# EAGLE design a13pg (EAGLE 9.6.2)
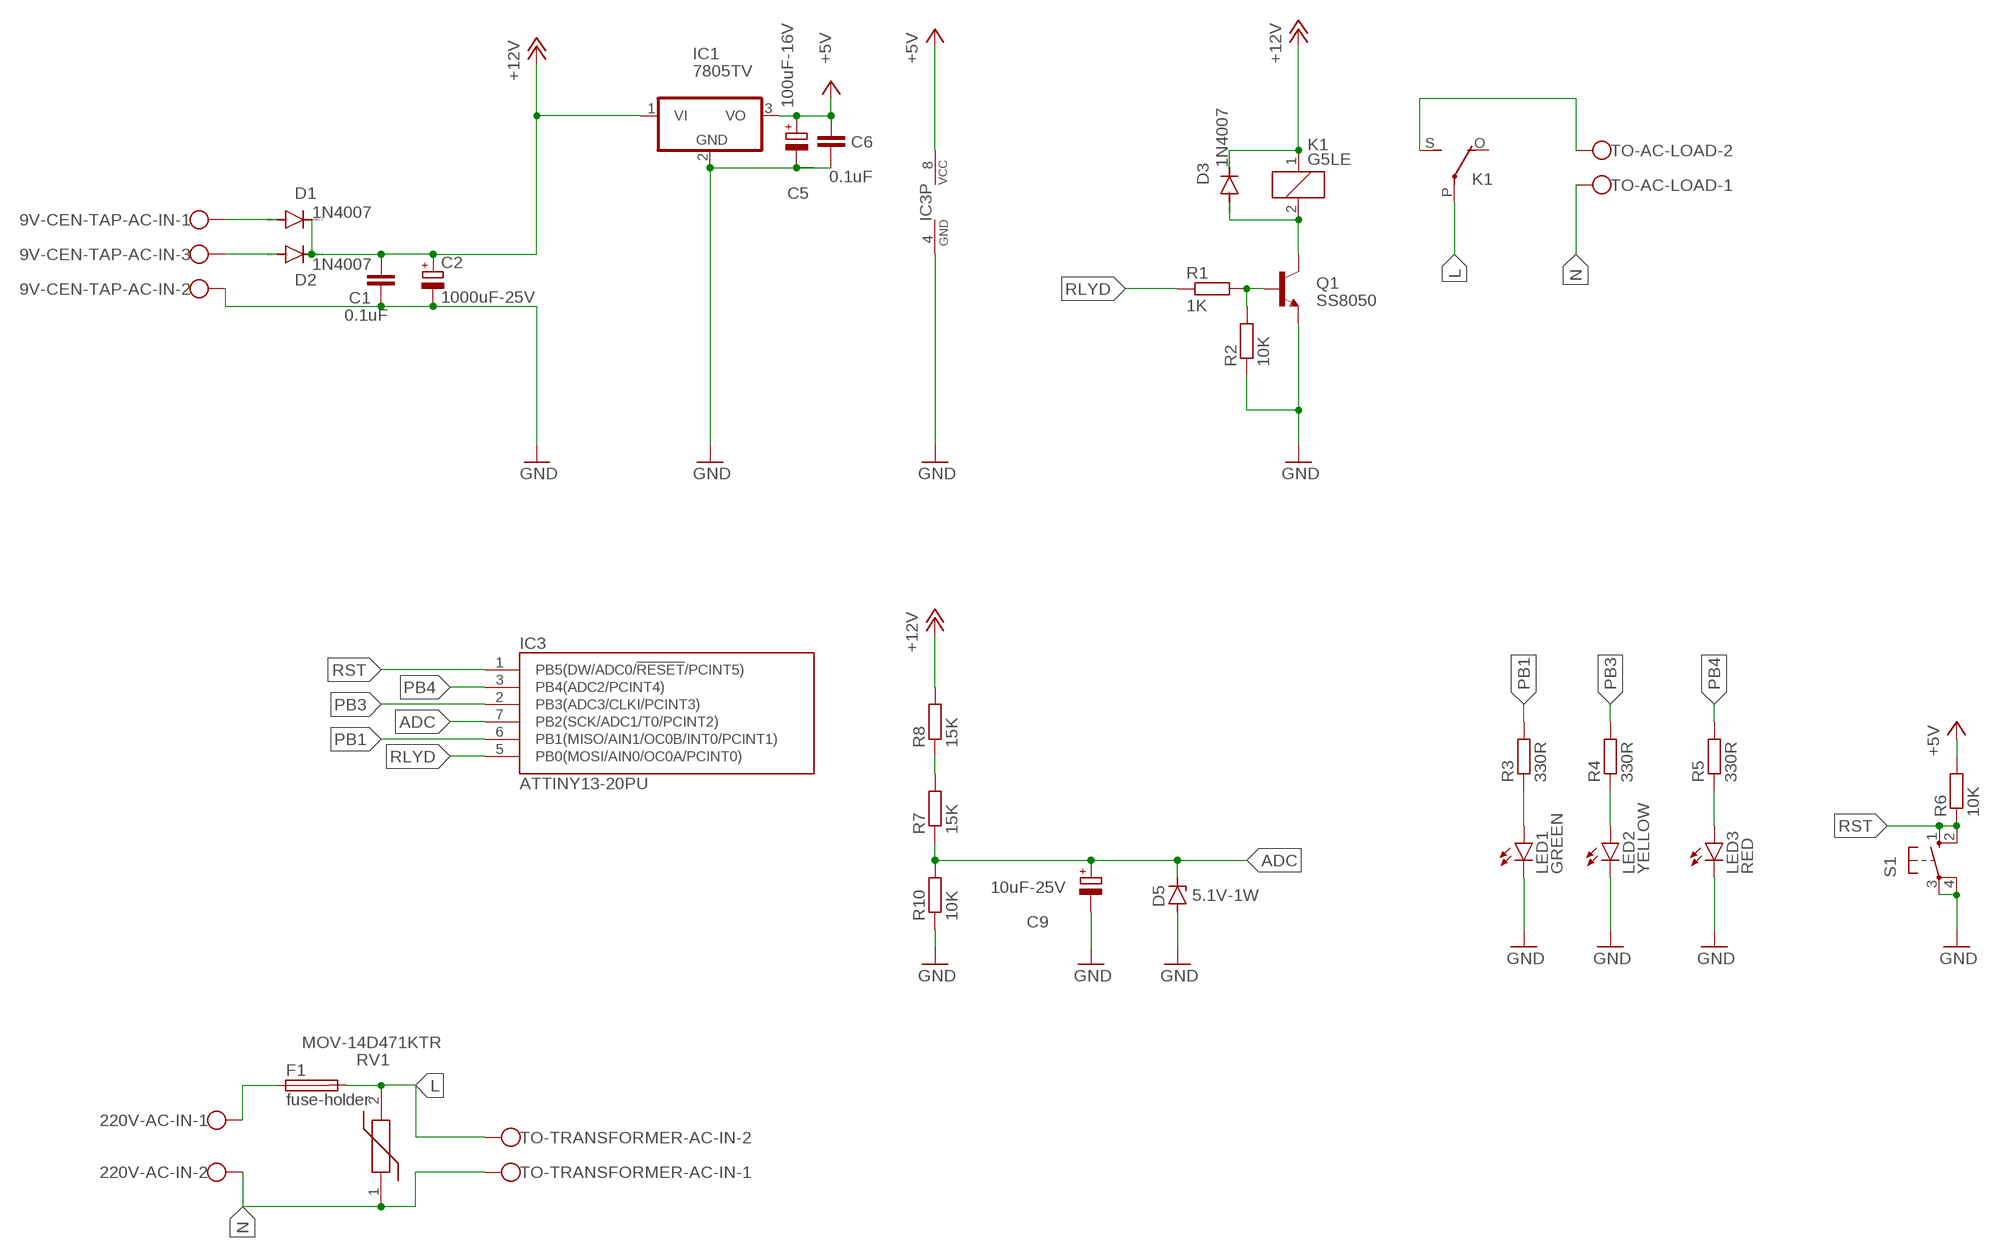
[diagram p0: schematic, sheet 1]

## Parts
9V-CEN-TAP-AC-IN  W237-103  [W237-103]
220V-AC-IN  2pinsctg  W237-102  [W237-102]
C1  0.1uF  C-EU075-032X103  [C075-032X103]
C2  1000uF-25V  CPOL-EUE5-8.5  [E5-8,5]
C5  100uF-16V  CPOL-EUE2,5-6E  [E2,5-6E]
C6  0.1uF  C-EU075-032X103  [C075-032X103]
C9  10uF-25V  CPOL-EUE2,5-6E  [E2,5-6E]
D1  1N4007  1N4004  [DO41-10]
D2  1N4007  1N4004  [DO41-10]
D3  1N4007  1N4004  [DO41-10]
D5  5.1V-1W  ZENER-DIODEDO35Z10  [DO35Z10]
F1  fuse-holder  SH22  [SH22]
IC1  7805TV  [TO220V]
IC3  ATTINY13-20PU  [DIL08]
K1  G5LE  [G5LE]
LED1  GREEN  LED5MM  [LED5MM]
LED2  YELLOW  LED5MM  [LED5MM]
LED3  RED  LED5MM  [LED5MM]
Q1  SS8050  [TO92]
R1  1K  R-EU_0207/7  [0207/7]
R2  10K  R-EU_0207/7  [0207/7]
R3  330R  R-EU_0207/7  [0207/7]
R4  330R  R-EU_0207/7  [0207/7]
R5  330R  R-EU_0207/7  [0207/7]
R6  10K  R-EU_0207/7  [0207/7]
R7  15K  R-EU_0207/7  [0207/7]
R8  15K  R-EU_0207/7  [0207/7]
R10  10K  R-EU_0207/7  [0207/7]
RV1  MOV-14D471KTR  [MOV14D471K]
S1  pbtn4pin  10-XX  [B3F-10XX]
TO-AC-LOAD  W237-102  [W237-102]
TO-TRANSFORMER-AC-IN  W237-102  [W237-102]

## Nets
+5V: C5.+ C6.2 IC1.3(VO) IC3.8(VCC) R6.2
+12V: C1.2 C2.+ D1.C D2.C D3.C IC1.1(VI) K1.1 R8.2
ADC: C9.+ D5.C IC3.7(PB2(SCK/ADC1/T0/PCINT2)) R7.1 R10.2
GND: 9V-CEN-TAP-AC-IN.2 C1.1 C2.- C5.- C6.1 C9.- D5.A IC1.2(GND) IC3.4(GND) LED1.K(C) LED2.K(C) LED3.K(C) Q1.3(E) R2.1 R10.1 S1.3(P) S1.4(P1)
L: F1.2 K1.P(2:P) RV1.2 TO-TRANSFORMER-AC-IN.2
N: 220V-AC-IN.2 RV1.1 TO-AC-LOAD.1 TO-TRANSFORMER-AC-IN.1
N$1: R7.2 R8.1
N$2: 9V-CEN-TAP-AC-IN.1 D1.A
N$3: 9V-CEN-TAP-AC-IN.3 D2.A
N$4: K1.S(2:S) TO-AC-LOAD.2
N$5: D3.A K1.2 Q1.1(C)
N$6: Q1.2(B) R1.2 R2.2
N$8: LED1.A R3.1
N$9: LED2.A R4.1
N$10: LED3.A R5.1
N$12: 220V-AC-IN.1 F1.1
PB1: IC3.6(PB1(MISO/AIN1/OC0B/INT0/PCINT1)) R3.2
PB3: IC3.2(PB3(ADC3/CLKI/PCINT3)) R4.2
PB4: IC3.3(PB4(ADC2/PCINT4)) R5.2
RLYD: IC3.5(PB0(MOSI/AIN0/OC0A/PCINT0)) R1.1
RST: IC3.1(PB5(DW/ADC0/!RESET!/PCINT5)) R6.1 S1.1(S) S1.2(S1)
Unconnected: K1.O(2:O)

## Library data of the parts
9V-CEN-TAP-AC-IN = con-wago-500:W237-103: WAGO SCREW CLAMP; MPN: 237-103; OC_FARNELL: unknown; OC_NEWARK: 18M7116
220V-AC-IN TO-AC-LOAD TO-TRANSFORMER-AC-IN = con-wago-500:W237-102: WAGO SCREW CLAMP; MPN: 237-102; OC_FARNELL: unknown; OC_NEWARK: 70K9898
C1 C6 = rcl:C-EU: CAPACITOR, European symbol; SPICEPREFIX: C
C2 C5 C9 = rcl:CPOL-EU: POLARIZED CAPACITOR, European symbol; SPICEPREFIX: C
D1-D3 = diode:1N4004: DIODE general purpose rectifier, 1 A
D5 = diode:ZENER-DIODE: Z-Diode
F1 = fuse:SH22: FUSE HOLDER CS PFP30, Schukat
IC1 = linear:78*: Positive VOLTAGE REGULATOR Source: http://cache.national.com/ds/LM/LM78L05.pdf http://www.fairchildsemi.com/ds/LM/LM7805.pdf
IC3 = atmel:ATTINY13: 8-bit AVR tiny Microcontroller Status obsolete/discontinued aktiv ATtiny13(V) ATtiny13A General purpose working registers 32 SRAM 64 B Program flash memory 1 kB EEPROM 64 B 8-bit Timer/Counter 1 USART 1 ADC channels 4 ADC resolution 10bit AC 1 Watchdog 1 General purpose I/O 6 External interrupts 6 Operating voltage 1.8 ... 5.5 V for ATtiny13V 1.8 ... 5.5 V 2.7 ... 5.5 V for ATtiny13 Speed grade 0 ... 4 MHz @ 1.8 ... 5.5 V for ATtiny13V 0 ... 4 MHz @ 1.8 ... 5.5 V 0 ... 10 MHz @ 2.7 ... 5.5 V for ATtiny13V 0 ... 10 MHz @ 2.7 ... 5.5 V 0 ... 10 MHz @ 2.7 ... 5.5 V for ATtiny13 0 ... 20 MHz @ 4.5 ... 5.5 V 0 ... 20 MHz @ 4.5 ... 5.5 V for ATtiny13 Clock options calibrated internal 4.8/9.6 MHz RC oscillator internal 128 kHz oscillator external clock input
K1 = relay:G5LE: RELAY 1 x switch, 10 A/120 V AC, 8 A/30 V DC, Omron; OC_FARNELL: unknown; OC_NEWARK: unknown
LED1-LED3 = led:LED: LED OSRAM: - CHIPLED LG R971, LG N971, LY N971, LG Q971, LY Q971, LO R971, LY R971 LH N974, LH R974 LS Q976, LO Q976, LY Q976 LO Q996 - Hyper CHIPLED LW Q18S LB Q993, LB Q99A, LB R99A - SideLED LS A670, LO A670, LY A670, LG A670, LP A670 LB A673, LV A673, LT A673, LW A673 LH A674 LY A675 LS A676, LA A676, LO A676, LY A676, LW A676 LS A679, LY A679, LG A679 - Hyper Micro SIDELED® LS Y876, LA Y876, LO Y876, LY Y876 LT Y87S - SmartLED LW L88C, LW L88S LB L89C, LB L89S, LG L890 LS L89K, LO L89K, LY L89K LS L896, LA L896, LO L896, LY L896 - TOPLED LS T670, LO T670, LY T670, LG T670, LP T670 LSG T670, LSP T670, LSY T670, LOP T670, LYG T670 LG T671, LOG T671, LSG T671 LB T673, LV T673, LT T673, LW T673 LH T674 LS T676, LA T676, LO T676, LY T676, LB T676, LH T676, LSB T676, LW T676 LB T67C, LV T67C, LT T67C, LS T67K, LO T67K, LY T67K, LW E67C LS E67B, LA E67B, LO E67B, LY E67B, LB E67C, LV E67C, LT E67C LW T67C LS T679, LY T679, LG T679 LS T770, LO T770, LY T770, LG T770, LP T770 LB T773, LV T773, LT T773, LW T773 LH T774 LS E675, LA E675, LY E675, LS T675 LS T776, LA T776, LO T776, LY T776, LB T776 LHGB T686 LT T68C, LB T68C - Hyper Mini TOPLED® LB M676 - Mini TOPLED Santana® LG M470 LS M47K, LO M47K, LY M47K Source: http://www.osram.convergy.de LUXEON: - LUMILED® LXK2-PW12-R00, LXK2-PW12-S00, LXK2-PW14-U00, LXK2-PW14-V00 LXK2-PM12-R00, LXK2-PM12-S00, LXK2-PM14-U00 LXK2-PE12-Q00, LXK2-PE12-R00, LXK2-PE12-S00, LXK2-PE14-T00, LXK2-PE14-U00 LXK2-PB12-K00, LXK2-PB12-L00, LXK2-PB12-M00, LXK2-PB14-N00, LXK2-PB14-P00, LXK2-PB14-Q00 LXK2-PR12-L00, LXK2-PR12-M00, LXK2-PR14-Q00, LXK2-PR14-R00 LXK2-PD12-Q00, LXK2-PD12-R00, LXK2-PD12-S00 LXK2-PH12-R00, LXK2-PH12-S00 LXK2-PL12-P00, LXK2-PL12-Q00, LXK2-PL12-R00 Source: www.luxeon.com KINGBRIGHT: KA-3528ASYC Source: www.kingbright.com
Q1 = ss8050-TO-92:SS8050: NPN Transistor Check prices <https://pricing.snapeda.com/search/part/SS8050/?ref=eda>; MP: SS8050
R1-R8 R10 = rcl:R-EU_: RESISTOR, European symbol; SPICEPREFIX: R
RV1 = MOV-14D471KTR:MOV-14D471KTR: BOURNS - MOV-14D471KTR - VARISTOR, METAL OXIDE, 470V, 14MM, 10% Source: Datasheet <https://www.bourns.com/data/global/pdfs/MOV14D.pdf>; ARROW_PART_NUMBER: MOV-14D471KTR; ARROW_PRICE-STOCK: https://www.arrow.com/en/products/mov-14d471ktr/bourns?utm_currency=USD&region=nac; DESCRIPTION: BOURNS - MOV-14D471KTR - VARISTOR, METAL OXIDE, 470V, 14MM, 10%; HEIGHT: 20mm; MANUFACTURER_NAME: Bourns; MANUFACTURER_PART_NUMBER: MOV-14D471KTR; MOUSER_PART_NUMBER: 652-MOV-14D471KTR; MOUSER_PRICE-STOCK: https://www.mouser.co.uk/ProductDetail/Bourns/MOV-14D471KTR?qs=CQ3B1E%252BbPs0cifVrEP3vgg%3D%3D
S1 = switch-omron:10-XX: OMRON SWITCH; MPN: B3F-1000; OC_FARNELL: 176432; OC_NEWARK: 36M3542

## Board
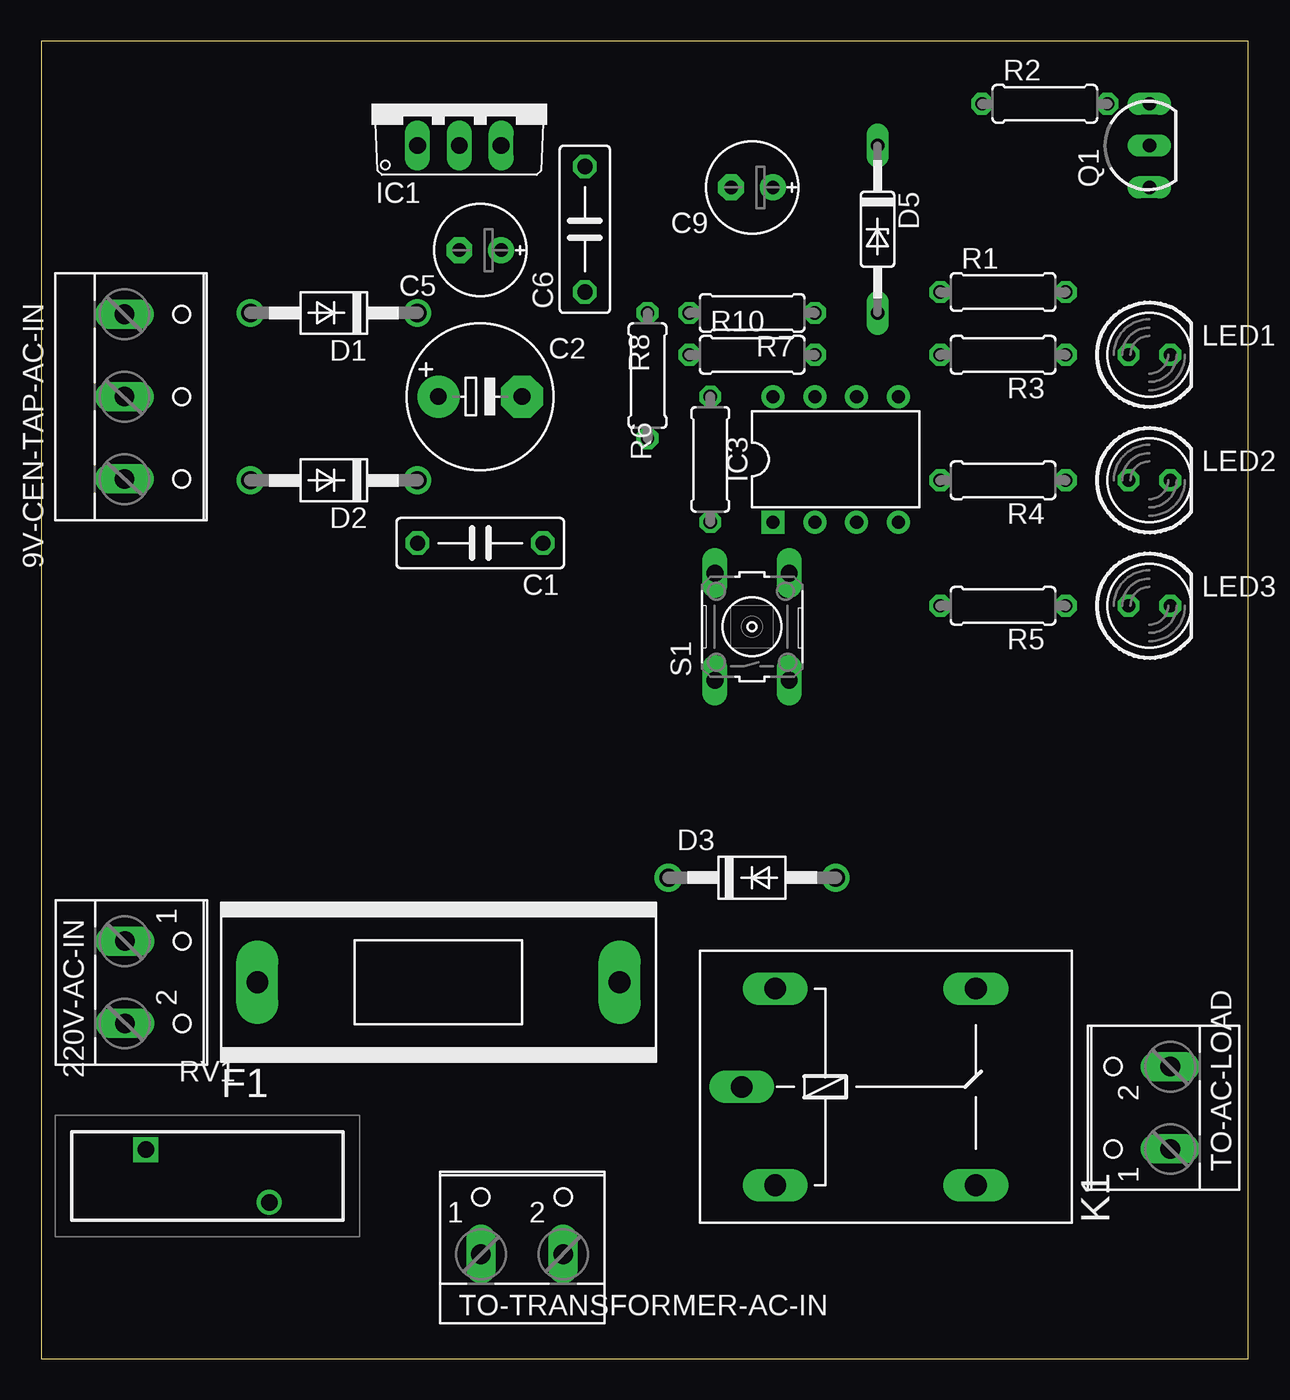
[diagram p1: board, top side]
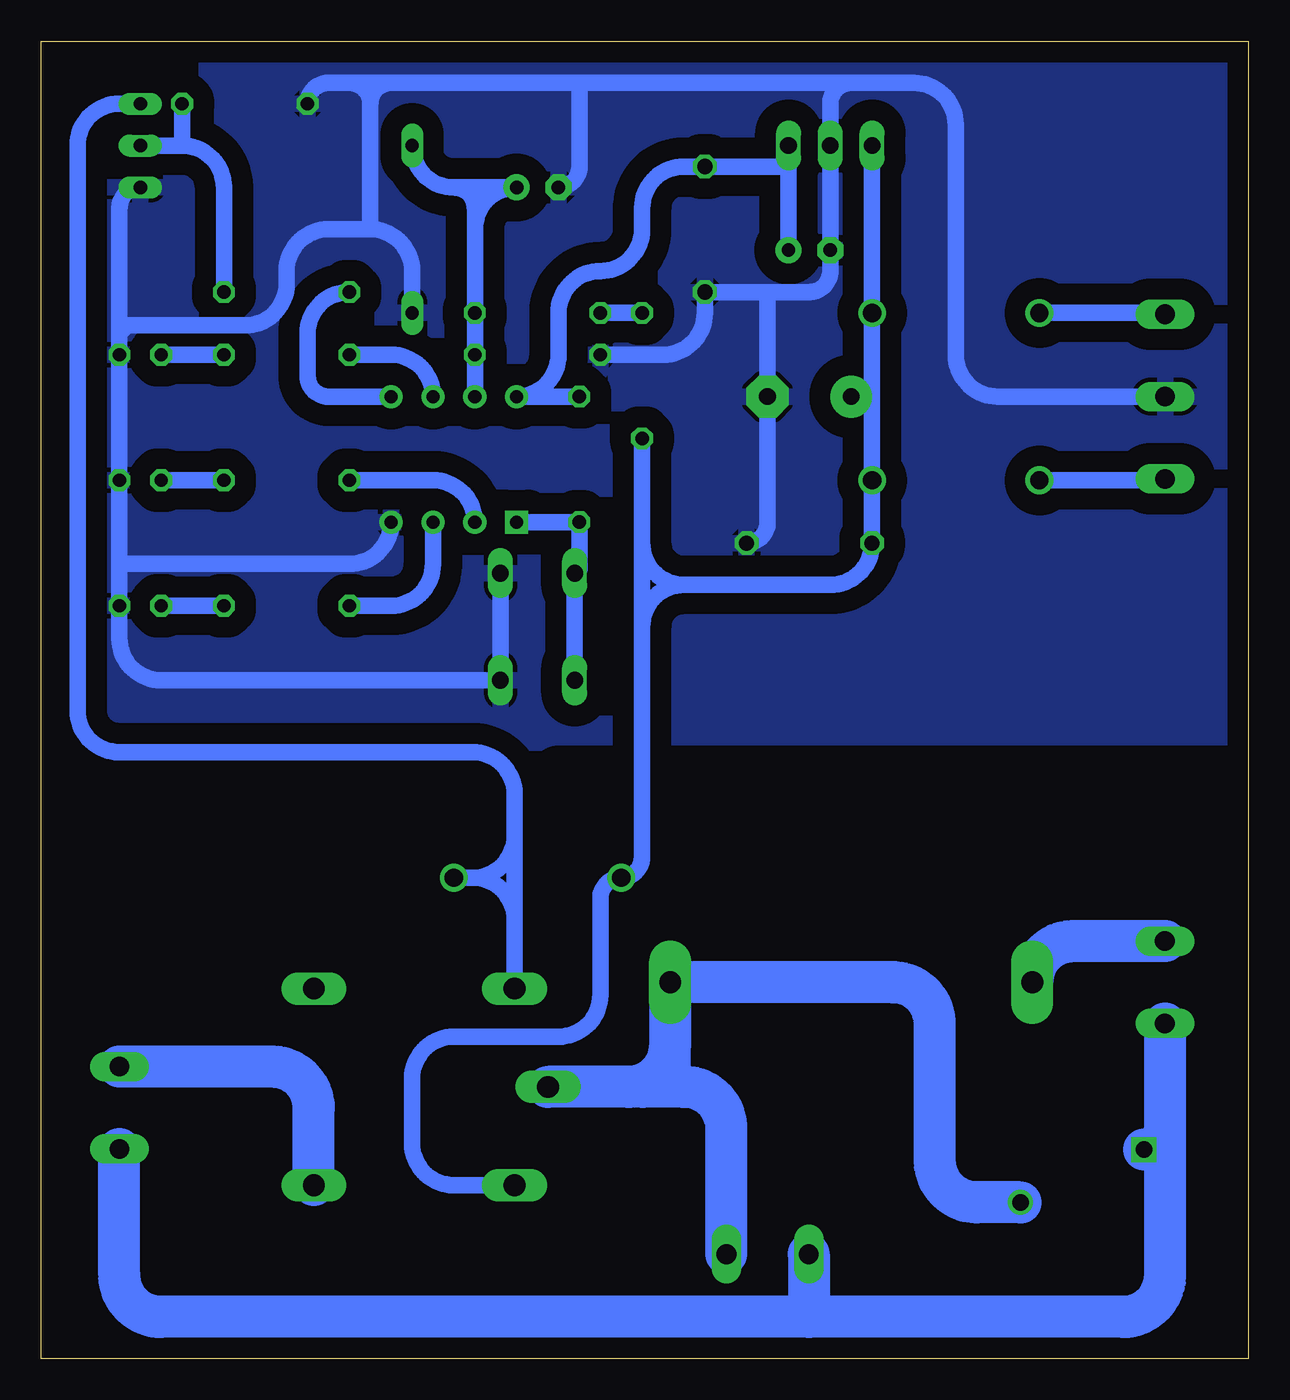
[diagram p2: board, bottom side, seen from below]

Size 73.33 x 80 mm. Coordinates in mm from the lower left corner, seen from the top.
Outline: 0,0 73.33,0 73.33,80 0,80 0,0
Copper layers (1*16): Top 0.035mm / dielectric 1.5mm / Bottom 0.035mm
Design rules "default": minimum track width 6mil, minimum drill 0.35mm, track to track 6mil, track to pad 6mil, pad to pad 6mil, via to via 6mil, smd to smd 6mil, copper to edge 40mil, drill to drill 6mil, minimum pad ring 10mil, minimum via ring 8mil, stop-mask expansion 4mil, vias tented up to drill 0mil, thermal gap 10mil
bRestrict: 3 lines

### Footprints (pad centres in the part's own frame; a part is rotated, then mirrored left to right if it is on the bottom)
W237-103 = drill 1.194 long: 1 -5,-1.29; 2 0,-1.29; 3 5,-1.29
W237-102 = drill 1.194 long: 1 -2.5,-1.27; 2 2.5,-1.27
C075-032X103 = drill 0.914 octagon: 1 -3.81,0; 2 3.81,0
E5-8,5 = drill 1.016 pad 2.54: + -2.54,0 | drill 1.016 pad 2.54 octagon: - 2.54,0
E2,5-6E = drill 0.813 pad 1.575: + -1.27,0 | drill 0.813 pad 1.575 octagon: - 1.27,0
DO41-10 = drill 1.118: A 5.08,0; C -5.08,0
DO35Z10 = drill 0.813 long: A 5.08,0; C -5.08,0
SH22 = drill 1.321 pad 2.54 long: 1 -10.998,0; 2 10.998,0
TO220V = drill 1.016 long: 1 -2.54,-2.54; 2 0,-2.54; 3 2.54,-2.54
DIL08 = drill 0.8 pad 1.4 square: 1 -3.81,-3.81 | drill 0.8 pad 1.4: 2 -1.27,-3.81; 3 1.27,-3.81; 4 3.81,-3.81; 5 3.81,3.81; 6 1.27,3.81; 7 -1.27,3.81; 8 -3.81,3.81
G5LE = drill 1.321 long: 1 -7.493,-5.969; 2 -7.493,5.969; O 4.699,5.969; P -9.525,0; S 4.699,-5.969
LED5MM = drill 0.813 octagon: A -1.27,0; K 1.27,0
TO92 = drill 0.813 long: 1 2.54,0; 2 0,0; 3 -2.54,0
0207/7 = drill 0.813 octagon: 1 -3.81,0; 2 3.81,0
MOV14D471K = drill 1 pad 1.5 square: 1 0,0 | drill 1 pad 1.5: 2 7.5,-3.2
B3F-10XX = drill 1.016 long: 1 -3.251,2.261; 2 3.251,2.261; 3 -3.251,-2.261; 4 3.251,-2.261

### Placement (x,y rotation side)
9V-CEN-TAP-AC-IN  6.35,58.42 270 top
220V-AC-IN  6.35,22.86 270 top
C1  26.67,49.53 180 top
C2  26.67,58.42 0 top
C5  26.67,67.31 180 top
C6  33.02,68.58 90 top
C9  43.18,71.12 180 top
D1  17.78,63.5 180 top
D2  17.78,53.34 180 top
D3  43.18,29.21 0 top
D5  50.8,68.58 270 top
F1  24.13,22.86 0 top
IC1  25.4,76.2 0 top
IC3  48.26,54.61 0 top
K1  52.07,16.51 0 top
LED1  67.31,60.96 0 top
LED2  67.31,53.34 0 top
LED3  67.31,45.72 0 top
Q1  67.31,73.66 90 top
R1  58.42,64.77 0 top
R2  60.96,76.2 0 top
R3  58.42,60.96 180 top
R4  58.42,53.34 180 top
R5  58.42,45.72 180 top
R6  40.64,54.61 90 top
R7  43.18,63.5 180 top
R8  36.83,59.69 270 top
R10  43.18,60.96 0 top
RV1  6.35,12.7 0 top
S1  43.18,44.45 90 top
TO-AC-LOAD  67.31,15.24 90 top
TO-TRANSFORMER-AC-IN  29.21,7.62 0 top

### Tracks (layer width: path | path; a pad name or v marks a point on that pad's centre or on a via)
+5V
  Bottom 1.016: R6.2 IC3.8 arc-90 41.91,60.96 41.91,63.5 arc90 39.37,66.04 arc-90 36.83,68.58 36.83,69.85 arc90 34.29,72.39 C6.2 27.94,72.39 | C5.+ 27.94,72.39 | 27.94,72.39 IC1.3
+12V
  Bottom 1.016: 22.86,58.42 D2.C C1.2 arc90 25.4,46.99 34.29,46.99 | 22.86,58.42 D1.C IC1.1 | C2.+ 22.86,58.42 | K1.1 48.26,10.54 arc90 50.8,13.08 50.8,17.02 arc90 48.26,19.56 41.91,19.56 arc-90 39.37,22.1 39.37,27.94 arc90 D3.C arc-90 36.83,30.48 36.83,44.45 | R8.2 36.83,49.53 | 36.83,49.53 arc-90 34.29,46.99 | 36.83,44.45 36.83,49.53 | 36.83,44.45 arc90 34.29,46.99
ADC
  Bottom 1.016: IC3.7 R10.2 R7.1 46.99,68.58 | 46.99,68.58 arc90 C9.+ 48.26,71.12 | 48.26,71.12 arc90 D5.C | 46.99,68.58 46.99,69.85 arc-90 48.26,71.12
GND
  Bottom 1.016: 68.58,48.26 LED2.K LED1.K 68.58,62.23 | 68.58,48.26 LED3.K 68.58,43.74 arc-90 66.04,41.2 S1.3 S1.4 | IC3.4 arc90 54.61,48.26 68.58,48.26 | 29.21,64.77 C6.1 33.02,63.5 arc90 35.56,60.96 R10.1 | 29.21,64.77 26.67,64.77 arc-90 25.4,66.04 C5.- IC1.2 25.4,76.2 arc90 24.13,77.47 | 29.21,64.77 C2.- 29.21,50.8 arc90 C1.1 | 9V-CEN-TAP-AC-IN.2 15.24,58.42 arc90 17.78,60.96 17.78,74.93 arc-90 20.32,77.47 24.13,77.47 | 40.64,77.47 50.8,77.47 52.07,77.47 | 40.64,77.47 24.13,77.47 | C9.- arc-90 40.64,72.39 40.64,77.47 | 68.58,62.23 68.07,62.74 60.96,62.74 arc-90 58.42,65.28 58.42,66.04 arc90 55.88,68.58 53.34,68.58 | 68.58,62.23 68.58,69.85 arc90 Q1.3 | 53.34,68.58 arc90 50.8,66.04 D5.A | 53.34,68.58 53.34,76.2 | 52.07,77.47 54.61,77.47 | 54.61,77.47 55.88,77.47 arc-90 R2.1 | 53.34,76.2 arc-90 54.61,77.47 | 53.34,76.2 arc90 52.07,77.47
  pour Bottom (isolate 1.27, rank 6): 8.89,80.01 73.66,80.01 73.66,77.47 73.66,0 53.34,0 0,0 0,15.24 0,80.01
L
  Bottom 2.54: RV1.2 16.51,9.5 arc90 19.05,12.04 19.05,20.32 arc-90 21.59,22.86 F1.2 35.13,19.05 | 36.79,16.51 K1.P | 35.13,19.05 arc90 37.67,16.51 K1.P | TO-TRANSFORMER-AC-IN.2 31.71,13.97 arc-90 34.25,16.51 | 34.25,16.51 K1.P | 34.25,16.51 arc90 35.13,17.39 35.13,19.05
N
  Bottom 2.54: 220V-AC-IN.2 5.08,13.97 | 5.08,13.97 arc90 RV1.1 | 5.08,13.97 5.08,5.08 arc90 7.62,2.54 26.67,2.54 | 26.67,2.54 66.04,2.54 arc90 68.58,5.08 TO-AC-LOAD.1 | TO-TRANSFORMER-AC-IN.1 26.71,2.58 arc-90 26.67,2.54
N$1
  Bottom 1.016: R8.1 R7.2
N$2
  Bottom 1.016: D1.A 5.14,63.5 arc90 9V-CEN-TAP-AC-IN.1
N$3
  Bottom 1.016: D2.A 5.14,53.34 arc-90 9V-CEN-TAP-AC-IN.3
N$4
  Bottom 2.54: K1.S 56.77,15.2 arc-90 59.31,17.74 TO-AC-LOAD.2
N$5
  Bottom 1.016: Q1.1 68.58,76.2 arc-90 71.12,73.66 71.12,39.37 arc-90 68.58,36.83 47.12,36.83 arc90 44.58,34.29 44.58,31.75 | K1.2 44.58,26.67 | 44.58,26.67 arc-90 47.12,29.21 | 44.58,26.67 44.58,31.75 | D3.A 47.12,29.21 | 47.12,29.21 arc-90 44.58,31.75
N$6
  Bottom 1.016: Q1.2 64.77,73.66 | 64.77,73.66 arc90 62.23,71.12 R1.2 | R2.2 64.77,73.66
N$8
  Bottom 1.016: R3.1 LED1.A
N$9
  Bottom 1.016: R4.1 LED2.A
N$10
  Bottom 1.016: LED3.A R5.1
N$12
  Bottom 2.54: 220V-AC-IN.1 10.63,25.36 arc-90 F1.1
PB1
  Bottom 1.016: R3.2 52.07,60.96 arc90 IC3.6
PB3
  Bottom 1.016: IC3.2 arc-90 49.53,53.34 R4.2
PB4
  Bottom 1.016: IC3.3 49.53,48.26 arc90 52.07,45.72 R5.2
RLYD
  Bottom 1.016: IC3.5 55.88,58.42 arc90 57.15,59.69 57.15,62.23 arc90 R1.1
RST
  Bottom 1.016: IC3.1 R6.1 40.64,47.98 arc90 S1.2 S1.1